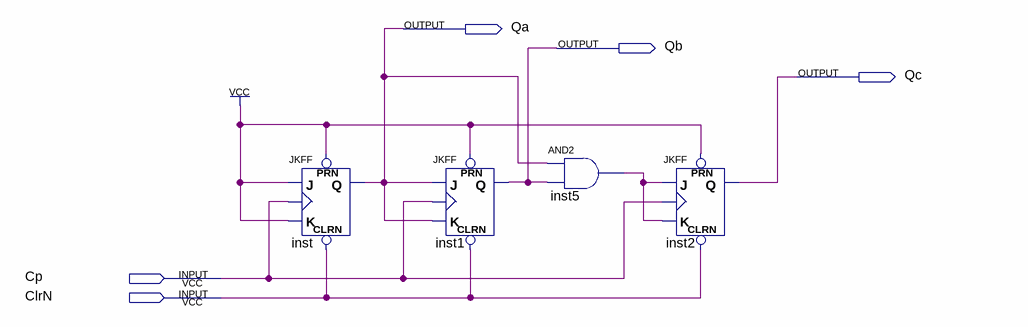
[diagram p0: schematic sheet]
// Quartus schematic 3bits_counter.bdf as structural Verilog: 4 symbols, 5 pins
module \3bits_counter  (
  input  Cp,
  input  ClrN,
  output Qa,
  output Qb,
  output Qc
);

  wire inst5_out;

  JKFF inst (.PRN(1'b1), .CLRN(ClrN), .K(1'b1), .J(1'b1), .CLK(Cp), .Q(Qa));
  JKFF inst1 (.PRN(1'b1), .CLRN(ClrN), .K(Qa), .J(Qa), .CLK(Cp), .Q(Qb));
  and inst5 (inst5_out, Qa, Qb);
  JKFF inst2 (.PRN(1'b1), .CLRN(ClrN), .K(inst5_out), .J(inst5_out), .CLK(Cp), .Q(Qc));
endmodule
